# Altium project HX PZ2.0-1X10P ZZ.PrjPcb
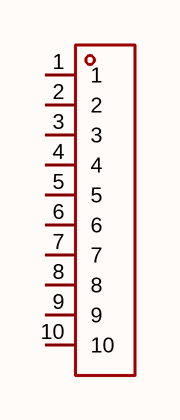
[diagram p0: HX PZ2.0-1X10P ZZ.schdoc]
1 sheet, 1 parts. Net scope: global (net labels, ports and power ports of the same name join across sheets).

## Sheet HX PZ2.0-1X10P ZZ.schdoc
size 127 x 101 mm

### Parts
H?  hx pz2.0-1x10p zz  [HDR-TH_10P-P2.00-V-M-1]  (value not drawn)

### Nets

Not connected (* = marked no-connect by the designer): H? 1 2 3 4 5 6 7 8 9 10

### Library data of the parts
H? = hx pz2.0-1x10p zz: 插针结构:1x10P;间距:2mm;行距:-;圆针/方针:方针;安装方式:直插;排数:单排;总PIN位数:10P;额定电流:1.5A;额定电压:500V;配合针长度:3.9mm;塑高:2mm;端接针长度:2.8mm;触头材质:黄铜;触头镀层:金;工作温度:-40℃~+105℃;颜色:黑色;; Manufacturer: hanxia(韩下); AddInBom: yes; ModelId: 64103dafda2540c78b17b1eaf7ad10a0; ModelName: HDR-TH_10P-P2.00-M-LI-1X10P; ModelTransform: 787.4,78.74,0,0,0,0,0,0,-118.11; Pin Structure: 1x10P; Pitch: 2mm; Circluar Pins/Square Pins: 方针; Current Rating: 1.5A; Voltage Rating (Max): 500V; Symbol: HX PZ2.0-1X10P ZZ; LCSC Part Name: 1x10P 间距:2mm 方针 直插; SupplierPart: C22438293; ManufacturerPart: HX PZ2.0-1x10P ZZ; Supplier Footprint: 插件,P=2mm; JLCPCB Part Class: Extended Part; Datasheet: https://item.szlcsc.com/datasheet/HX%2520PZ2.0-1x10P%2520ZZ/24075388.html; Supplier: LCSC; ConvertToPcb: yes; FootprintName: HDR-TH_10P-P2.00-V-M-1; Row Spacing: -; Mounting Type: 直插; Number of Rows: 单排; Number of Pins: 10P; Length of Mating Pin: 3.9mm; Insulation Height: 2mm; Length of End Connection Pin: 2.8mm; Contact Material: 黄铜; Contact Plating: 金; Operating Temperature: -40℃~+105℃; Color: 黑色; Supplementary Features: -